# EasyEDA Pro project SciOly_EV_Controller_v1.epro, schematic Schematic1

## Sheets
1 1 Power: Board Name: Board1; Create Date: 2026-11-18; Page Name: P1; Project Name: SciOly EV Controller; Schematic Name: Schematic1; Update Date: 2026-11-18; Company: EasyEDA.com; Page Size: A4; Version: V1.0
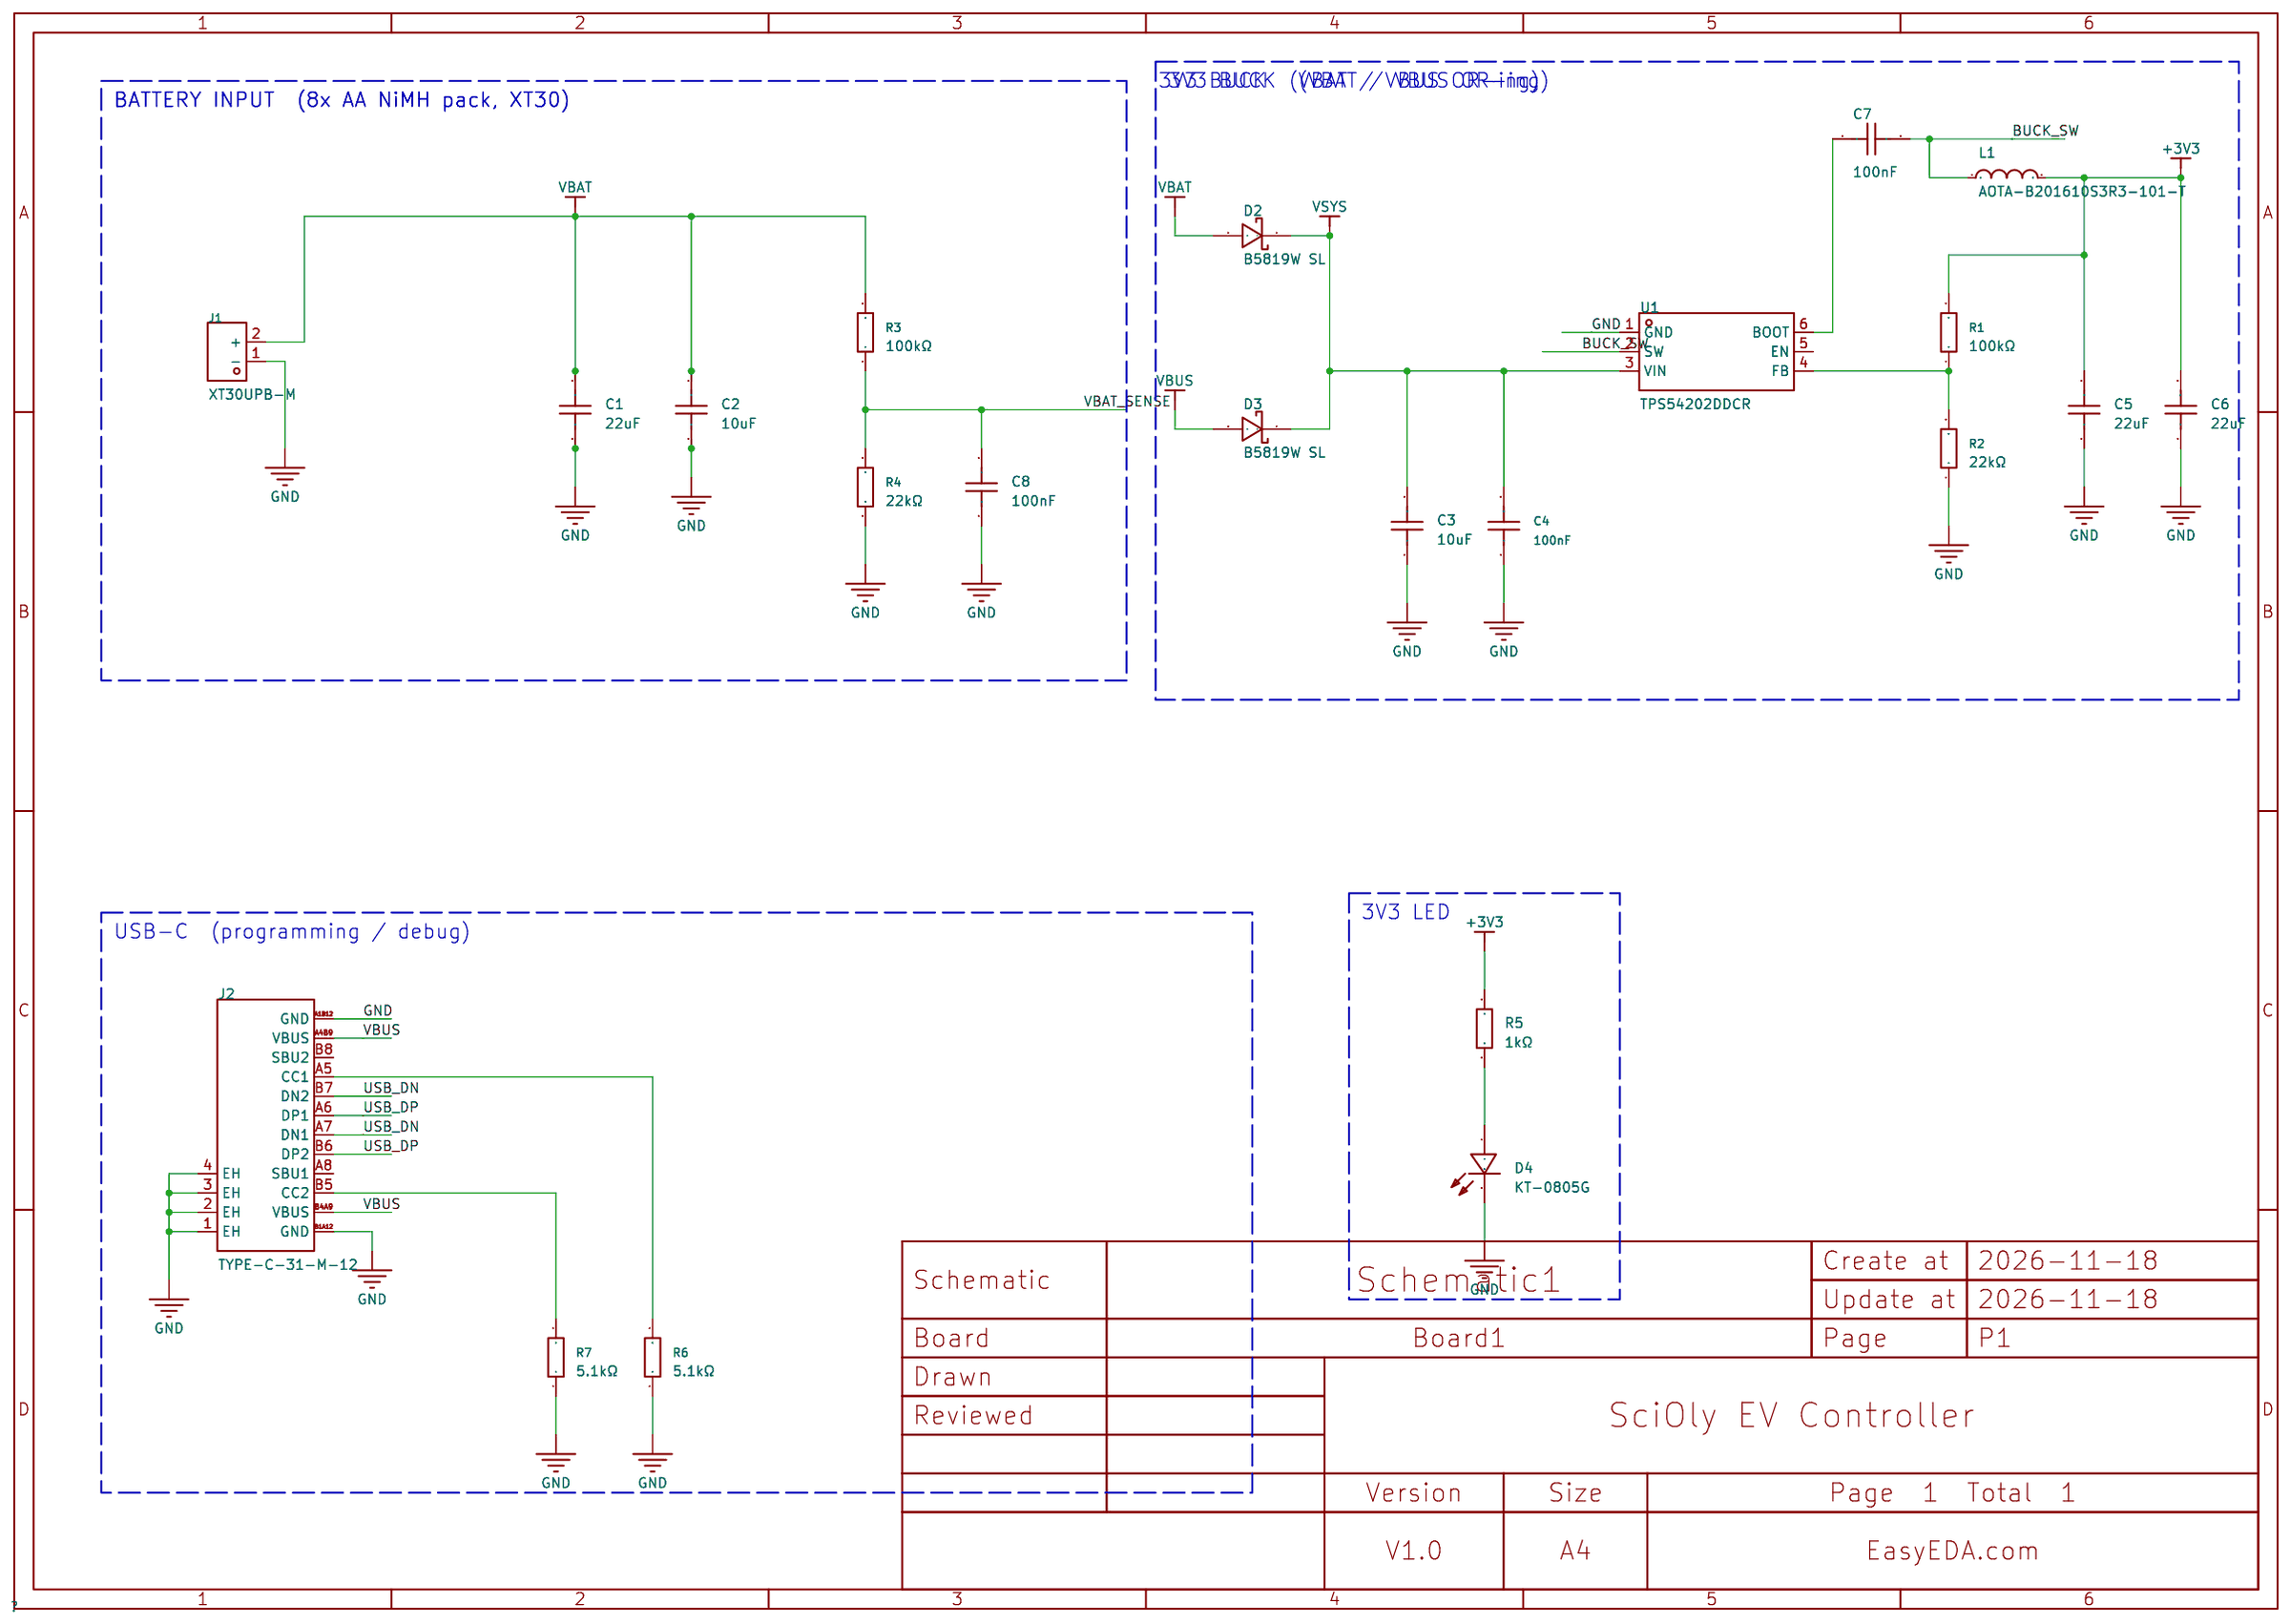
[diagram p0: 1 Power]
2 2 MCU: Page Name: 2 MCU; Update Date: 2026-11-20; Page Size: A3
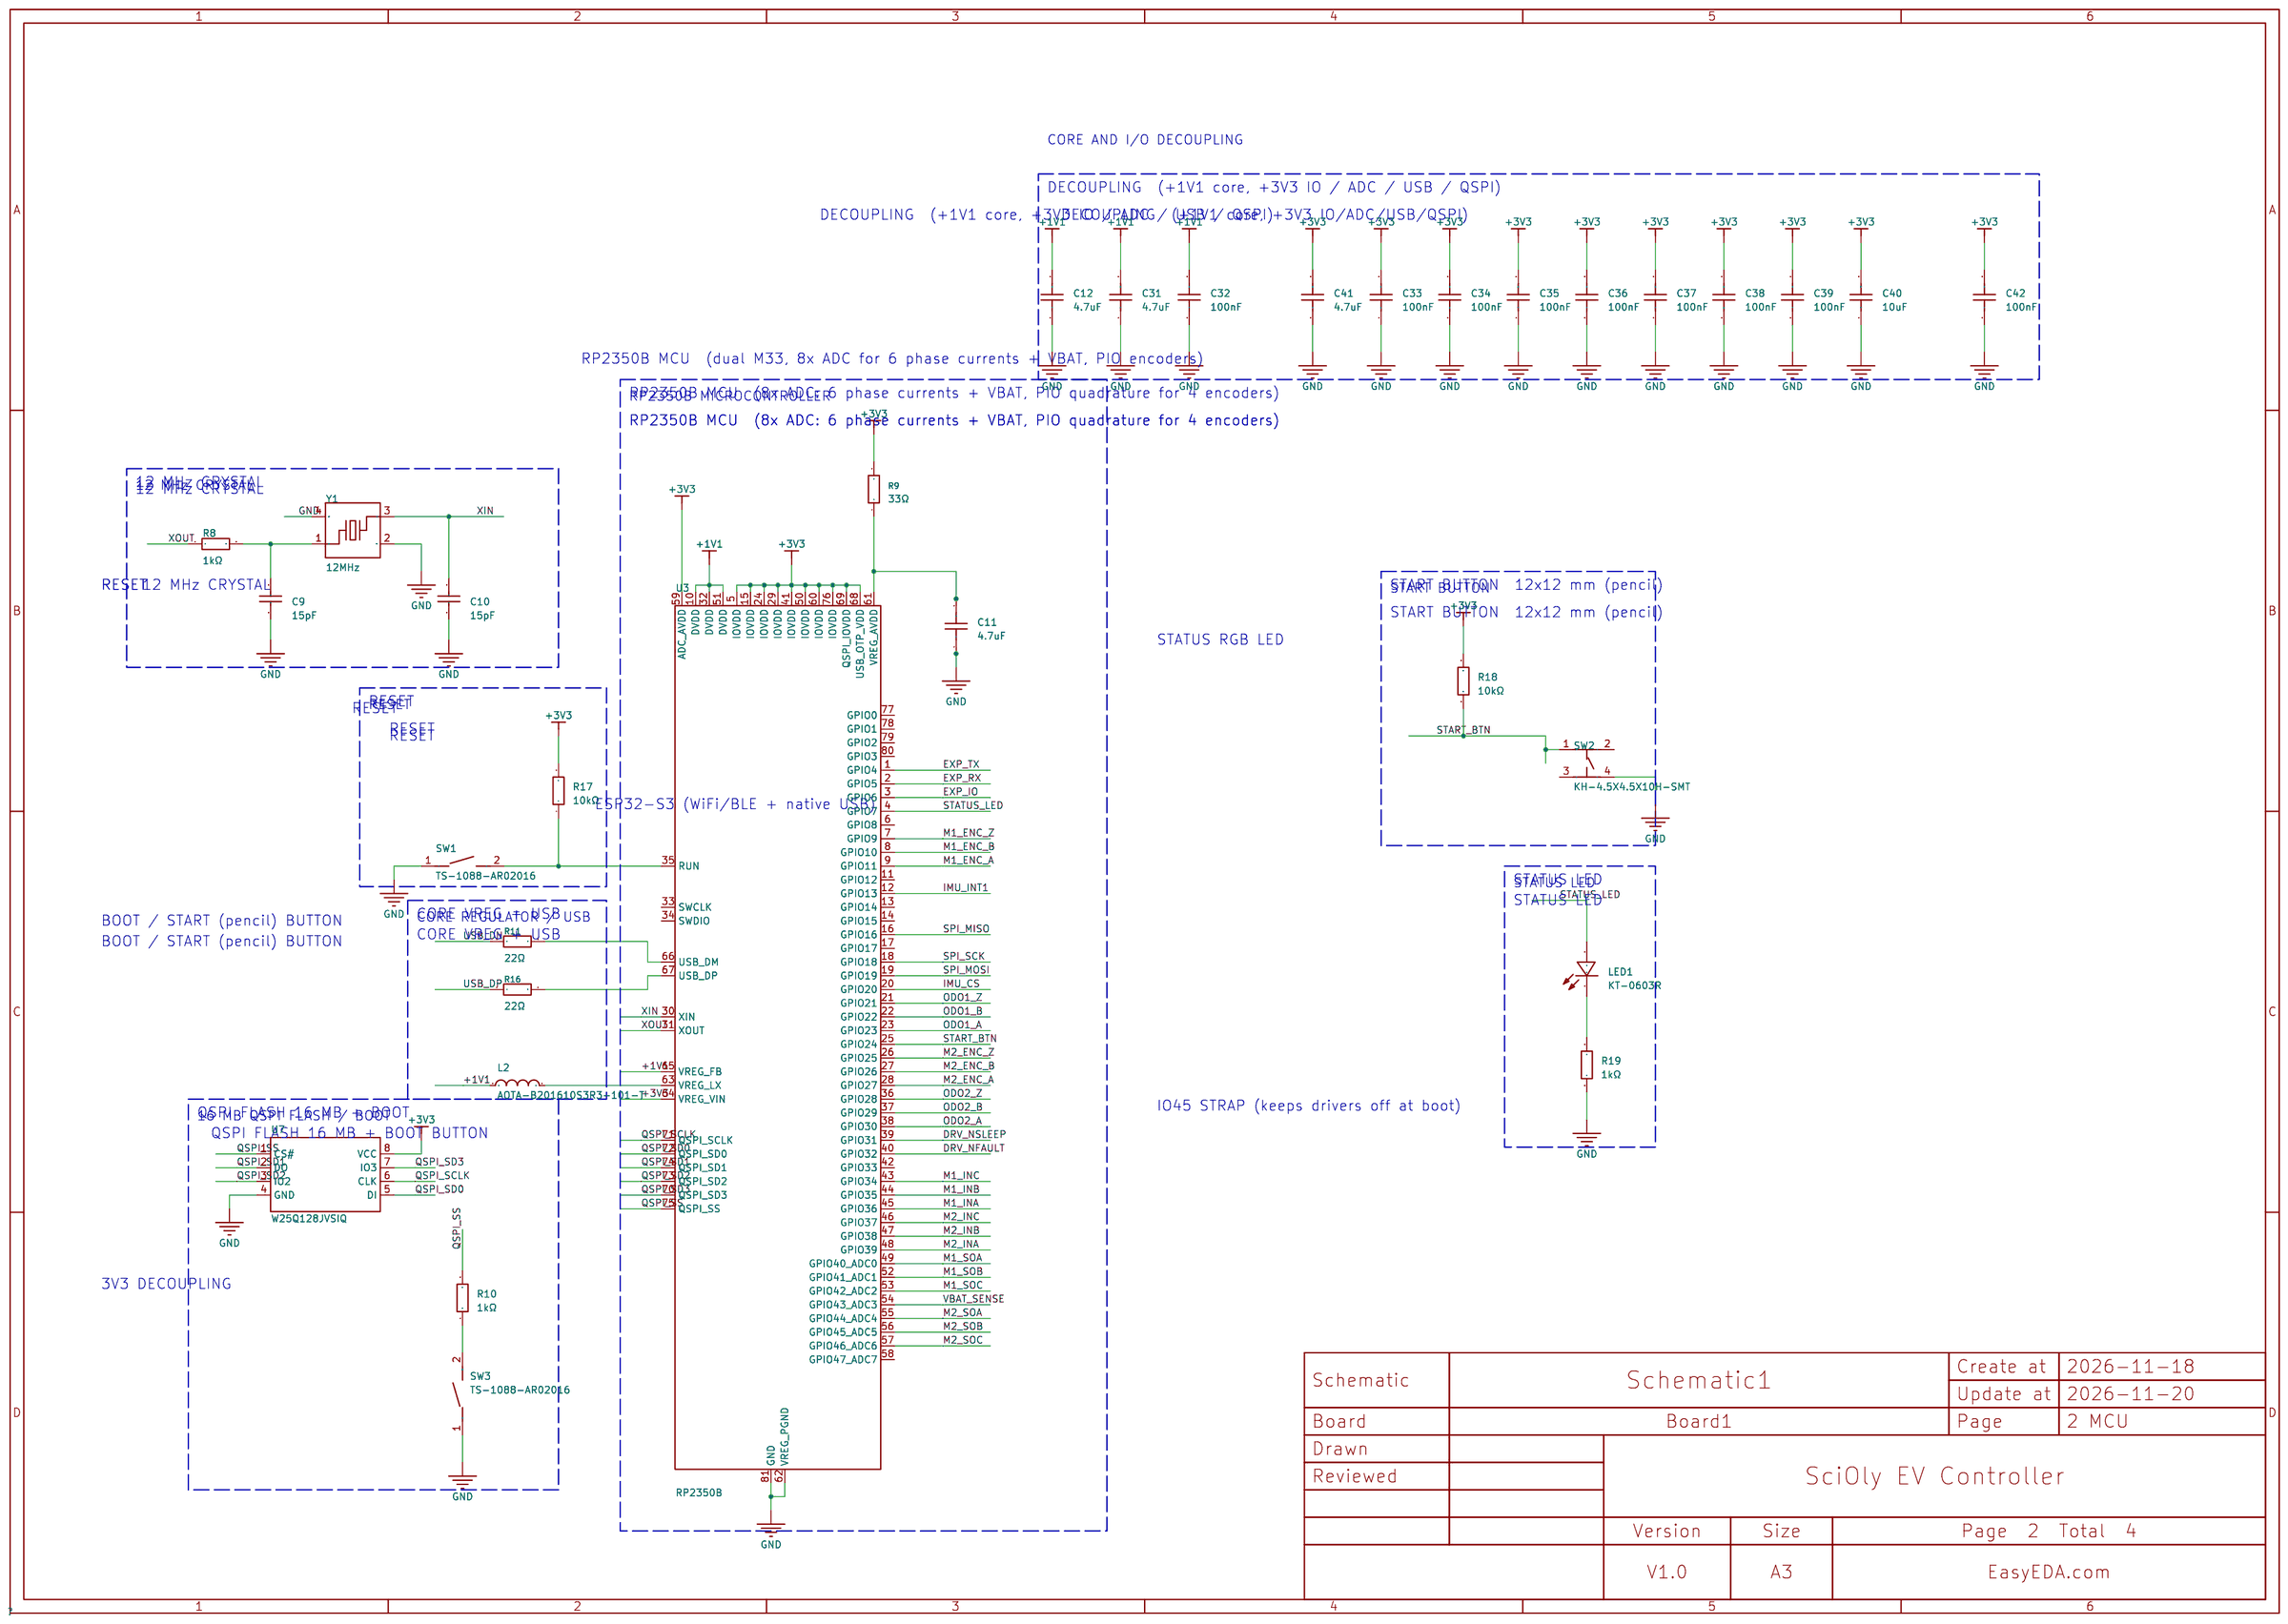
[diagram p1: 2 MCU]
3 3 Motor Drivers: Page Name: P2
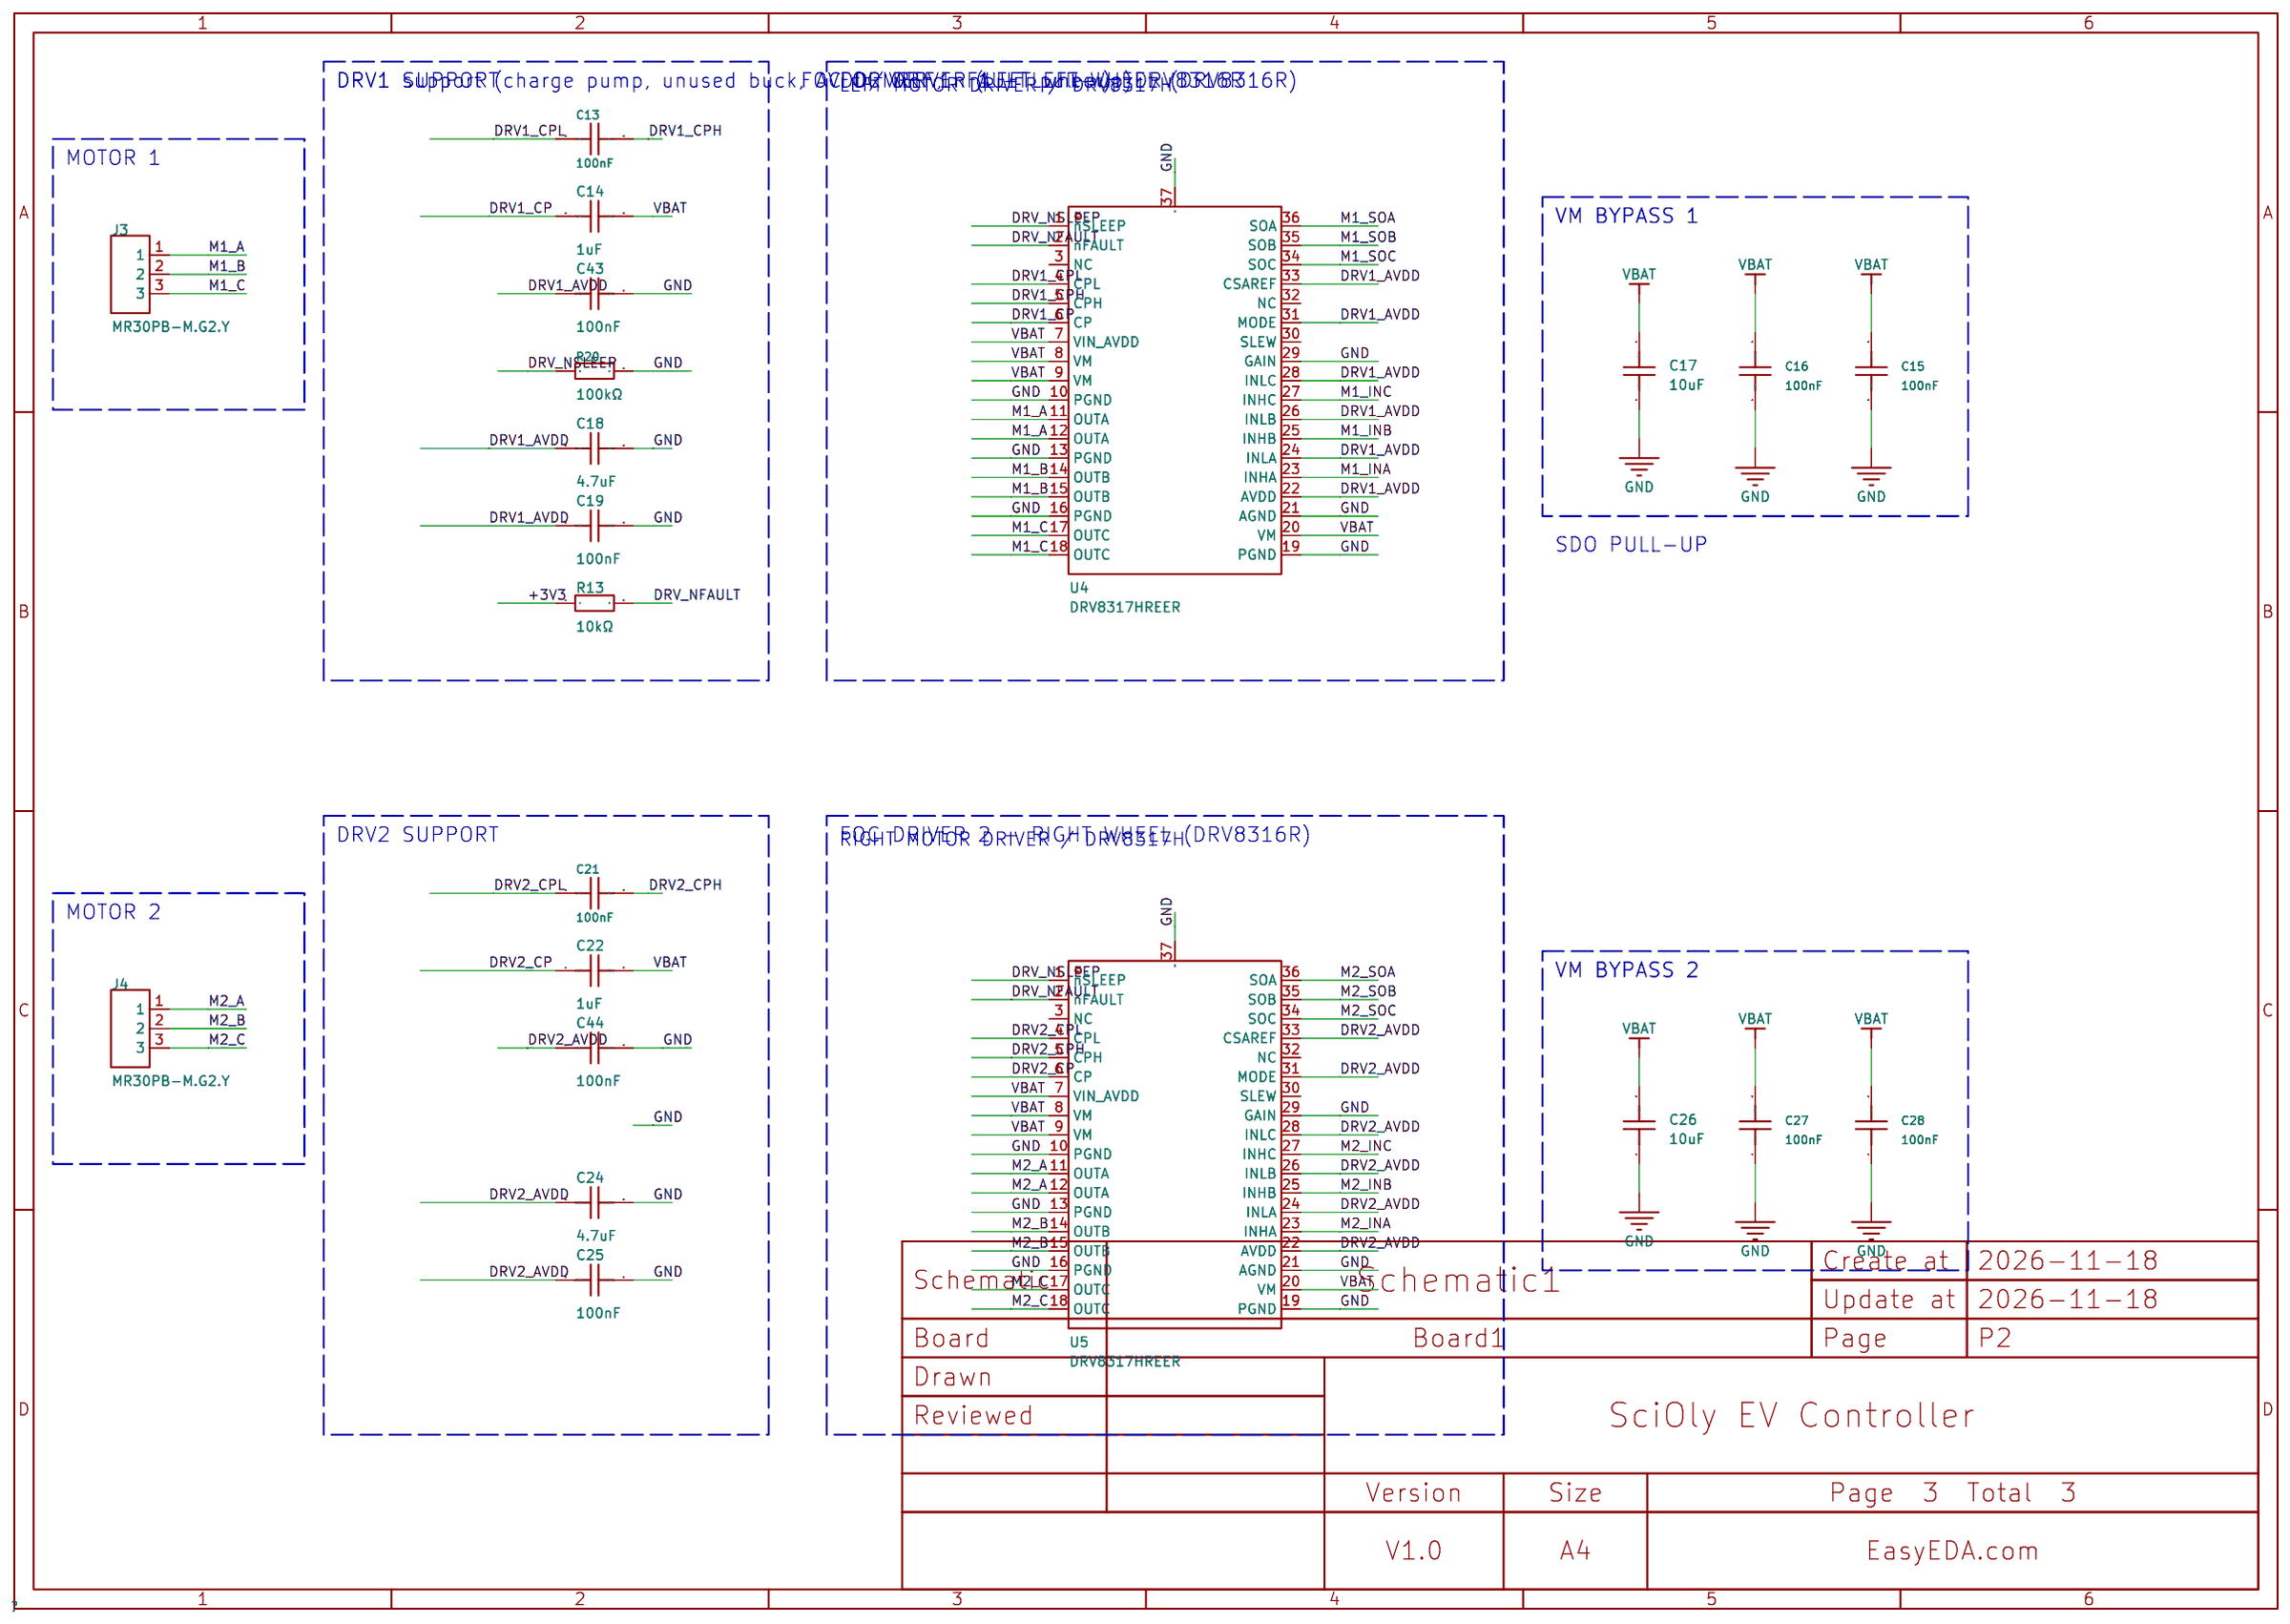
[diagram p2: 3 Motor Drivers]
4 4 Sensors and IO
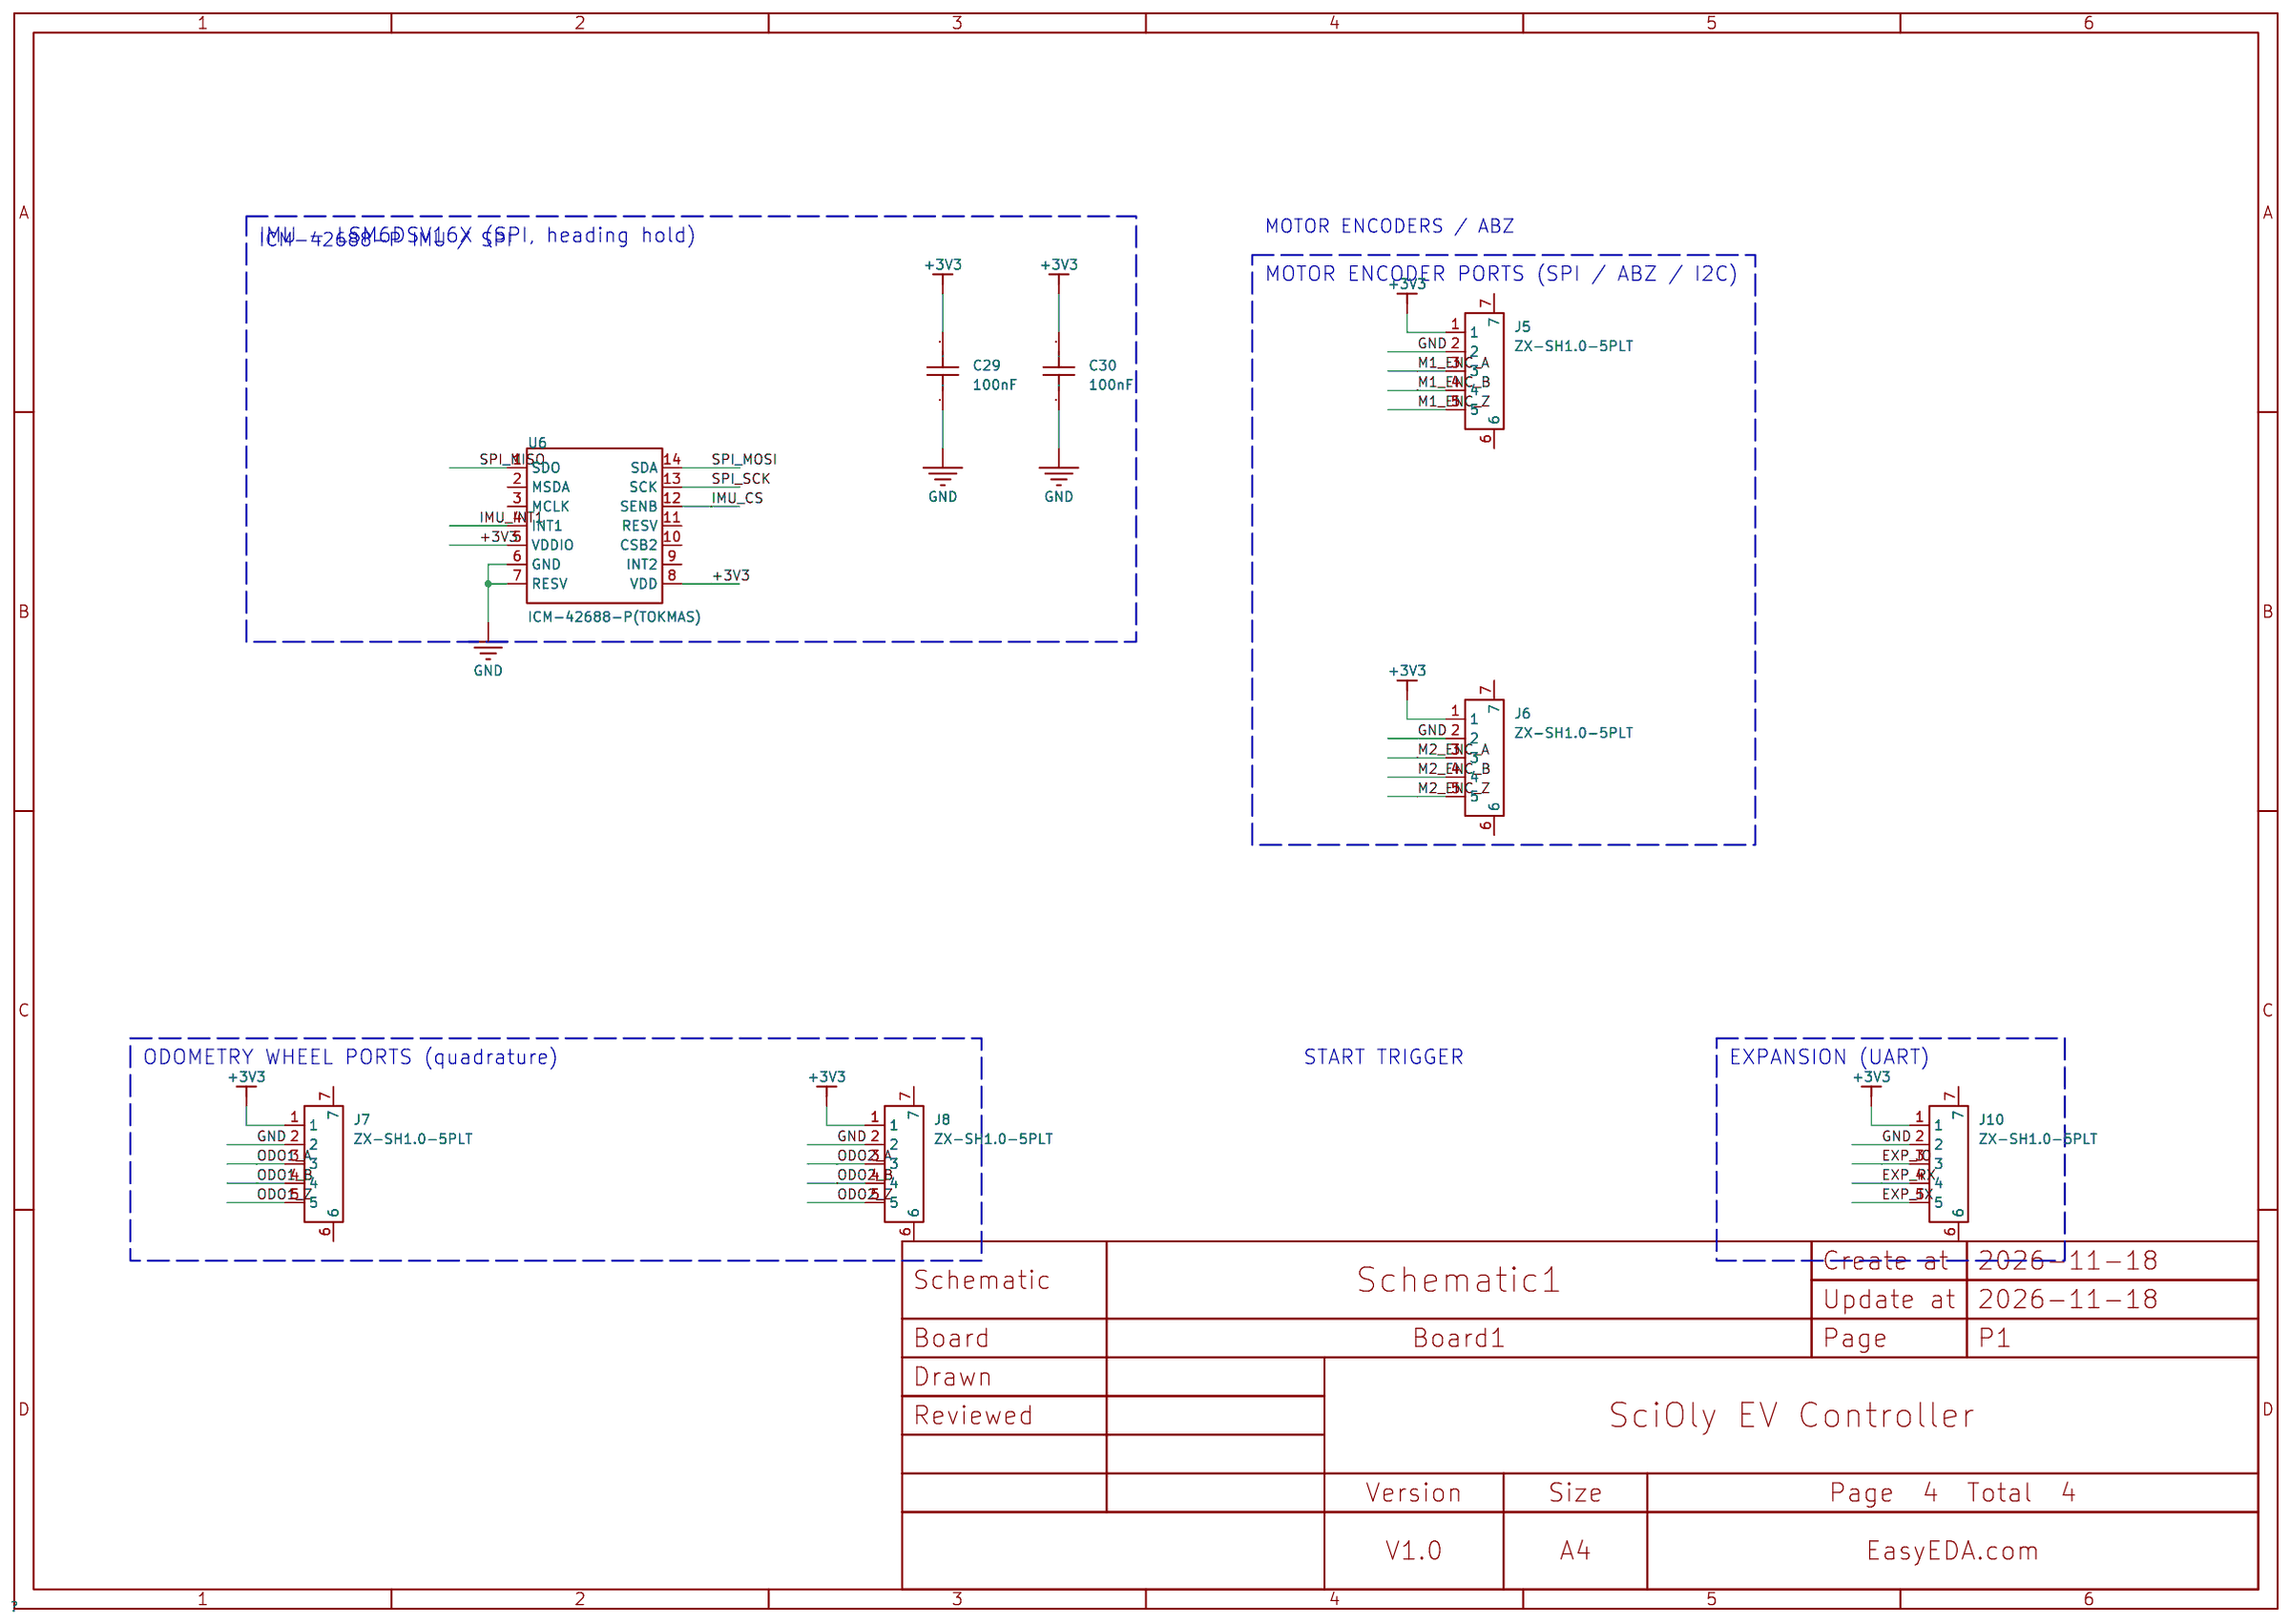
[diagram p3: 4 Sensors and IO]

## Parts
sheet 1 Power
C1  22uF  [C0805]
C2  10uF  [C0805]
C3  10uF  [C0805]
C4  100nF  [C0603]
C5  22uF  [C0805]
C6  22uF  [C0805]
C7  100nF  [C0402]
C8  100nF  [C0402]
D2  B5819W SL  [SOD-123_L2.7-W1.6-LS3.7-RD-1]
D3  B5819W SL  [SOD-123_L2.7-W1.6-LS3.7-RD-1]
D4  KT-0805G  [LED0805-R-RD]
J1  XT30UPB-M  [CONN-TH_XT30UPB-M]
J2  TYPE-C-31-M-12  [USB-C_SMD-TYPE-C-31-M-12_1]
L1  3.3uH  [IND-SMD_L2.0-W1.6_AOTA-B201610S3R3-101-T]
R1  100kΩ  [R0402]
R2  22kΩ  [R0402]
R3  100kΩ  [R0402]
R4  22kΩ  [R0402]
R5  1kΩ  [R0402]
R6  5.1kΩ  [R0402]
R7  5.1kΩ  [R0402]
U1  TPS54202DDCR  [SOT-23-6_L2.9-W1.6-P0.95-LS2.8-BL]
sheet 2 MCU
C9  15pF  [C0402]
C10  15pF  [C0402]
C11  4.7uF  [C0402]
C12  4.7uF  [C0402]
C31  4.7uF  [C0402]
C32  100nF  [C0402]
C33  100nF  [C0402]
C34  100nF  [C0402]
C35  100nF  [C0402]
C36  100nF  [C0402]
C37  100nF  [C0402]
C38  100nF  [C0402]
C39  100nF  [C0402]
C40  10uF  [C0603]
C41  4.7uF  [C0402]
C42  100nF  [C0402]
L2  3.3uH  [IND-SMD_L2.0-W1.6_AOTA-B201610S3R3-101-T]
LED1  KT-0603R  [LED-SMD_L1.6-W0.8-R-RD]
R8  1kΩ  [R0402]
R9  33Ω  [R0402]
R10  1kΩ  [R0402]
R11  22Ω  [R0402]
R16  22Ω  [R0402]
R17  10kΩ  [R0402]
R18  10kΩ  [R0402]
R19  1kΩ  [R0402]
SW1  TS-1088-AR02016  [SW-SMD_L3.9-W3.0-P4.45]
SW2  KH-4.5X4.5X10H-SMT  [SW-SMD_4P-L4.5-W4.5-P3.00-LS6.8]
SW3  TS-1088-AR02016  [SW-SMD_L3.9-W3.0-P4.45]
U3  RP2350B  [QFN-80_L10.0-W10.0-P0.40-TL-EP3.4]
U7  W25Q128JVSIQ  [SOIC-8_L5.3-W5.3-P1.27-LS8.0-BL]
Y1  12MHz  [CRYSTAL-SMD_4P-L3.2-W2.5-BL]
sheet 3 Motor Drivers
C13  100nF  [C0603]
C14  1uF  [C0402]
C15  100nF  [C0603]
C16  100nF  [C0603]
C17  10uF  [C0805]
C18  4.7uF  [C0402]
C19  100nF  [C0402]
C21  100nF  [C0603]
C22  1uF  [C0402]
C24  4.7uF  [C0402]
C25  100nF  [C0402]
C26  10uF  [C0805]
C27  100nF  [C0603]
C28  100nF  [C0603]
C43  100nF  [C0402]
C44  100nF  [C0402]
J3  MR30PB-M.G2.Y  [CONN-TH_MR30PB-M]
J4  MR30PB-M.G2.Y  [CONN-TH_MR30PB-M]
R13  10kΩ  [R0402]
R20  100kΩ  [R0402]
U4  DRV8317HREER  [QFN-36_L5.0-W4.0-P0.40-BL-EP]
U5  DRV8317HREER  [QFN-36_L5.0-W4.0-P0.40-BL-EP]
sheet 4 Sensors and IO
C29  100nF  [C0402]
C30  100nF  [C0402]
J5  ZX-SH1.0-5PLT  [CONN-SMD_5P-P1.00_ZX-SH1.0-5PLT]
J6  ZX-SH1.0-5PLT  [CONN-SMD_5P-P1.00_ZX-SH1.0-5PLT]
J7  ZX-SH1.0-5PLT  [CONN-SMD_5P-P1.00_ZX-SH1.0-5PLT]
J8  ZX-SH1.0-5PLT  [CONN-SMD_5P-P1.00_ZX-SH1.0-5PLT]
J10  ZX-SH1.0-5PLT  [CONN-SMD_5P-P1.00_ZX-SH1.0-5PLT]
U6  ICM-42688-P(TOKMAS)  [LGA-14_L3.0-W2.5-P0.50-BL]

## Library data of the parts
C1 C5 C6 = CL21A226MAQNNNE: Capacitance:22uF Tolerance:±20% Tolerance:±20% Voltage Rating:25V Temperature Coefficient:X5R; LCSC Part Name: 22uF ±20% 25V; Supplier Part: C45783; Manufacturer: SAMSUNG(三星); Supplier Footprint: 0805; JLCPCB Part Class: Basic Part; Datasheet: https://item.szlcsc.com/datasheet/CL21A226MAQNNNE/46786.html; Supplier: LCSC; Tolerance: ±20%; Voltage Rating: 25V; Temperature Coefficient: X5R
C2 C3 C17 C26 = CL21A106KAYNNNE_C15850: Capacitance:10uF Tolerance:±10% Tolerance:±10% Voltage Rating:25V Temperature Coefficient:X5R; LCSC Part Name: 10uF ±10% 25V; Supplier Part: C15850; Manufacturer: SAMSUNG(三星); Manufacturer Part: CL21A106KAYNNNE; Supplier Footprint: 0805; JLCPCB Part Class: Basic Part; Datasheet: https://item.szlcsc.com/datasheet/CL21A106KAYNNNE/16532.html; Supplier: LCSC; Tolerance: ±10%; Voltage Rating: 25V; Temperature Coefficient: X5R
C4 C13 C15 C16 C21 C27 C28 = CC0603KRX7R9BB104: Capacitance:100nF Tolerance:±10% Tolerance:±10% Voltage Rating:50V Temperature Coefficient:X7R; LCSC Part Name: 100nF ±10% 50V; Supplier Part: C14663; Manufacturer: YAGEO(国巨); Supplier Footprint: 0603; JLCPCB Part Class: Basic Part; Datasheet: https://item.szlcsc.com/datasheet/CC0603KRX7R9BB104/15331.html; Supplier: LCSC; Tolerance: ±10%; Voltage Rating: 50V; Temperature Coefficient: X7R
C7 C8 C19 C25 C29 C30 C32-C39 C42-C44 = CL05B104KO5NNNC: Capacitance:100nF Tolerance:±10% Tolerance:±10% Voltage Rating:16V Temperature Coefficient:X7R; LCSC Part Name: 100nF ±10% 16V; Supplier Part: C1525; Manufacturer: SAMSUNG(三星); Supplier Footprint: 0402; JLCPCB Part Class: Basic Part; Datasheet: https://item.szlcsc.com/datasheet/CL05B104KO5NNNC/1877.html; Supplier: LCSC; Tolerance: ±10%; Voltage Rating: 16V; Temperature Coefficient: X7R
D2 D3 = B5819W SL: Voltage - Forward(Vf@If):600mV@1A Voltage - DC Reverse(Vr):40V Current - Rectified:1A Non-Repetitive Peak Forward Surge Current:9A; LCSC Part Name: 电压:40V 电流:1A; Supplier Part: C8598; Manufacturer: CJ(江苏长电/长晶); Supplier Footprint: SOD-123; JLCPCB Part Class: Basic Part; Datasheet: https://item.szlcsc.com/datasheet/B5819W%2520SL/9093.html; Supplier: LCSC; Voltage - Forward(Vf@If): 600mV@1A; Voltage - DC Reverse(Vr): 40V; Current - Rectified: 1A; Non-Repetitive Peak Forward Surge Current: 9A
D4 = KT-0805G: Lamp Holder Type:2mm x 1.25mm square LED Illumination Color:Emerald Green Voltage - Forward(Vf):2.6V~3.1V Voltage - Forward(Vf):2.6V~3.1V Power(Watts):100mW Forward Current:5mA Wavelength - Dominant:513nm~528nm Wavelength - Dominant:513nm~528nm Peak Wavel; LCSC Part Name: 0805 翠绿 高亮; Supplier Part: C2297; Manufacturer: KENTO; Supplier Footprint: 0805; JLCPCB Part Class: Basic Part; Datasheet: https://item.szlcsc.com/datasheet/KT-0805G/2670.html; Supplier: LCSC; Lamp Holder Type: 2mm x 1.25mm square LED; Illumination Color: Emerald Green; Voltage - Forward(Vf): 2.6V~3.1V; Power(Watts): 100mW; Forward Current: 5mA; Wavelength - Dominant: 513nm~528nm; Peak Wavelength: 525nm; Diode Configuration: Discrete Diode; Lens Color: Water Clear; Luminous Intensity: 430mcd; Viewing Angle: 120°; Operating Temperature: -40℃~+85℃
J1 = XT30UPB-M: Rated current:15A Rated voltage: colour:Yellow Connector type:Model aircraft plug contact resistance: interface form:Male insulating material: metal material:Gold plating; LCSC Part Name: AMASS(艾迈斯)板载立式 航模锂电池控制器连接器插头 PCB板立式 公头XT30UPB-M.G.Y; Supplier Part: C428721; Manufacturer: AMASS(艾迈斯); JLCPCB Part Class: Extended Part; Datasheet: https://item.szlcsc.com/datasheet/XT30UPB-M/423831.html; Supplier: LCSC; Rated current: 15A; colour: Yellow; Connector type: Model aircraft plug; interface form: Male; metal material: Gold plating
J2 = TYPE-C-31-M-12: Connector Type:Type-C Protocol Standard:- Gender:Female Mounting Type:Surface Mount, Right Angle Number of Contacts:16P Number of Ports:1 Current Rating-Power:5A Voltage Rating:20V Connect-Disconnect Life:10,000 cycles Length:7.35mm Operating Temperature:; LCSC Part Name: Type-C 母 卧贴; Supplier Part: C165948; Manufacturer: 韩国韩荣; Supplier Footprint: SMD; JLCPCB Part Class: Extended Part; Datasheet: https://item.szlcsc.com/datasheet/TYPE-C-31-M-12/177331.html; Supplier: LCSC; Connector Type: Type-C; Gender: Female; Mounting Type: Surface Mount, Right Angle; Number of Contacts: 16P; Number of Ports: 1; Current Rating-Power: 5A; Voltage Rating: 20V; Connect-Disconnect Life: 10,000 cycles; Length: 7.35mm; Operating Temperature: -30℃~+80℃
L1 L2 = AOTA-B201610S3R3-101-T: LCSC Part Name: 3.3uH 2.4A; Supplier Part: C42411119; Manufacturer: ABRACON; Supplier Footprint: 0806; JLCPCB Part Class: Extended Part; Datasheet: https://item.szlcsc.com/datasheet/AOTA-B201610S3R3-101-T/44392932.html; Supplier: LCSC
R1 R3 R20 = 0402WGF1003TCE: Type:Thick Film Resistor Resistance:100kΩ Tolerance:±1% Tolerance:±1% Power(Watts):62.5mW Voltage-Supply(Max):50V Temperature Coefficient:±100ppm/℃ Temperature Coefficient:±100ppm/℃ Operating Temperature:-55℃~+155℃ Operating Temperature:-55℃~+155℃; LCSC Part Name: 厚膜电阻 100kΩ ±1%; Supplier Part: C25741; Manufacturer: UNI-ROYAL(厚声); Supplier Footprint: 0402; JLCPCB Part Class: Basic Part; Datasheet: https://item.szlcsc.com/datasheet/0402WGF1003TCE/26484.html; Supplier: LCSC; Type: Thick Film Resistor; Tolerance: ±1%; Power(Watts): 62.5mW; Voltage-Supply(Max): 50V; Temperature Coefficient: ±100ppm/℃; Operating Temperature: -55℃~+155℃
R2 R4 = 0402WGF2202TCE: Type:Thick Film Resistor Resistance:22kΩ Tolerance:±1% Tolerance:±1% Power(Watts):62.5mW Voltage-Supply(Max):50V Temperature Coefficient:±100ppm/℃ Temperature Coefficient:±100ppm/℃ Operating Temperature:-55℃~+155℃ Operating Temperature:-55℃~+155℃; LCSC Part Name: 厚膜电阻 22kΩ ±1%; Supplier Part: C25768; Manufacturer: UNI-ROYAL(厚声); Supplier Footprint: 0402; JLCPCB Part Class: Basic Part; Datasheet: https://item.szlcsc.com/datasheet/0402WGF2202TCE/26511.html; Supplier: LCSC; Type: Thick Film Resistor; Tolerance: ±1%; Power(Watts): 62.5mW; Voltage-Supply(Max): 50V; Temperature Coefficient: ±100ppm/℃; Operating Temperature: -55℃~+155℃
R5 R8 R10 R19 = 0402WGF1001TCE: Type:Thick Film Resistor Resistance:1kΩ Tolerance:±1% Tolerance:±1% Power(Watts):62.5mW Voltage-Supply(Max):50V Temperature Coefficient:±100ppm/℃ Temperature Coefficient:±100ppm/℃ Operating Temperature:-55℃~+155℃ Operating Temperature:-55℃~+155℃; LCSC Part Name: 厚膜电阻 1kΩ ±1%; Supplier Part: C11702; Manufacturer: UNI-ROYAL(厚声); Supplier Footprint: 0402; JLCPCB Part Class: Basic Part; Datasheet: https://item.szlcsc.com/datasheet/0402WGF1001TCE/12256.html; Supplier: LCSC; Type: Thick Film Resistor; Tolerance: ±1%; Power(Watts): 62.5mW; Voltage-Supply(Max): 50V; Temperature Coefficient: ±100ppm/℃; Operating Temperature: -55℃~+155℃
R6 R7 = 0402WGF5101TCE: Type:Thick Film Resistor Resistance:5.1kΩ Tolerance:±1% Tolerance:±1% Power(Watts):62.5mW Voltage-Supply(Max):50V Temperature Coefficient:±100ppm/℃ Temperature Coefficient:±100ppm/℃ Operating Temperature:-55℃~+155℃ Operating Temperature:-55℃~+155℃; LCSC Part Name: 厚膜电阻 5.1kΩ ±1%; Supplier Part: C25905; Manufacturer: UNI-ROYAL(厚声); Supplier Footprint: 0402; JLCPCB Part Class: Basic Part; Datasheet: https://item.szlcsc.com/datasheet/0402WGF5101TCE/26648.html; Supplier: LCSC; Type: Thick Film Resistor; Tolerance: ±1%; Power(Watts): 62.5mW; Voltage-Supply(Max): 50V; Temperature Coefficient: ±100ppm/℃; Operating Temperature: -55℃~+155℃
U1 = TPS54202DDCR: Function:Step-down type Voltage - Supply:4.5V~28V Voltage - Supply:4.5V~28V Output Voltage:- Output Voltage:- Output Current:2A Frequency - Switching:500kHz Frequency - Switching:500kHz Operating Temperature:-40℃~+125℃@(TJ) Operating Temperature:-40℃~+125; LCSC Part Name: 降压型 2A 4.5V~28V; Supplier Part: C191884; Manufacturer: TI(德州仪器); Supplier Footprint: SOT-23-6; JLCPCB Part Class: Extended Part; Datasheet: https://www.ti.com/cn/lit/ds/symlink/tps54202.pdf; Supplier: LCSC; Function: Step-down type; Voltage - Supply: 4.5V~28V; Output Current: 2A; Frequency - Switching: 500kHz; Operating Temperature: -40℃~+125℃@(TJ); Synchronous Rectifier: Yes; Number of Outputs: 1; Topology: Buck; Quiescent Current: 45uA; Switch tube (built-in/external): Built-in; Output Type: Adjustable; Features: Light load efficient mode；Cycle-by-cycle current limiting；Overcurrent Protection；EMI optimization (spread spectrum)；Hiccup current limiting
C9 C10 = 0402CG150J500NT: Capacitance:15pF Tolerance:±5% Tolerance:±5% Voltage Rating:50V Temperature Coefficient:C0G; LCSC Part Name: 15pF ±5% 50V; Supplier Part: C1548; Manufacturer: FH(风华); Supplier Footprint: 0402; JLCPCB Part Class: Basic Part; Datasheet: https://item.szlcsc.com/datasheet/0402CG150J500NT/1900.html; Supplier: LCSC; Tolerance: ±5%; Voltage Rating: 50V; Temperature Coefficient: C0G
C11 C12 C18 C24 C31 C41 = CL05A475MP5NRNC: Capacitance:4.7uF Tolerance:±20% Tolerance:±20% Voltage Rating:10V Temperature Coefficient:X5R; LCSC Part Name: 4.7uF ±20% 10V; Supplier Part: C23733; Manufacturer: SAMSUNG(三星); Supplier Footprint: 0402; JLCPCB Part Class: Basic Part; Datasheet: https://item.szlcsc.com/datasheet/CL05A475MP5NRNC/24469.html; Supplier: LCSC; Tolerance: ±20%; Voltage Rating: 10V; Temperature Coefficient: X5R
C40 = CL10A106KP8NNNC: Capacitance:10uF Tolerance:±10% Tolerance:±10% Voltage Rating:10V Temperature Coefficient:X5R; LCSC Part Name: 10uF ±10% 10V; Supplier Part: C19702; Manufacturer: SAMSUNG(三星); Supplier Footprint: 0603; JLCPCB Part Class: Basic Part; Datasheet: https://item.szlcsc.com/datasheet/CL10A106KP8NNNC/20411.html; Supplier: LCSC; Tolerance: ±10%; Voltage Rating: 10V; Temperature Coefficient: X5R
LED1 = KT-0603R: Lamp Holder Type:1.6mm x 0.8mm square LED Illumination Color:Red Voltage - Forward(Vf):1.8V~2.4V Voltage - Forward(Vf):1.8V~2.4V Power(Watts):40mW Forward Current:20mA Wavelength - Dominant:615nm~630nm Wavelength - Dominant:615nm~630nm Peak Wavelength:645; LCSC Part Name: 0603 红灯 高亮; Supplier Part: C2286; Manufacturer: KENTO; Supplier Footprint: 0603; JLCPCB Part Class: Basic Part; Datasheet: https://item.szlcsc.com/datasheet/KT-0603R/2659.html; Supplier: LCSC; Lamp Holder Type: 1.6mm x 0.8mm square LED; Illumination Color: Red; Voltage - Forward(Vf): 1.8V~2.4V; Power(Watts): 40mW; Forward Current: 20mA; Wavelength - Dominant: 615nm~630nm; Peak Wavelength: 645nm; Diode Configuration: Discrete Diode; Lens Color: Water Clear; Luminous Intensity: 300mcd; Viewing Angle: 120°; Operating Temperature: -40℃~+85℃
R9 = 0402WGF330JTCE: Type:Thick Film Resistor Resistance:33Ω Tolerance:±1% Tolerance:±1% Power(Watts):62.5mW Voltage-Supply(Max):50V Temperature Coefficient:±100ppm/℃ Temperature Coefficient:±100ppm/℃ Operating Temperature:-55℃~+155℃ Operating Temperature:-55℃~+155℃; LCSC Part Name: 33Ω ±1% 62.5mW 厚膜电阻; Supplier Part: C25105; Manufacturer: UNI-ROYAL(厚声); Supplier Footprint: 0402; JLCPCB Part Class: Basic Part; Datasheet: https://item.szlcsc.com/datasheet/0402WGF330JTCE/25848.html; Supplier: LCSC; Type: Thick Film Resistor; Tolerance: ±1%; Power(Watts): 62.5mW; Voltage-Supply(Max): 50V; Temperature Coefficient: ±100ppm/℃; Operating Temperature: -55℃~+155℃
R11 R16 = 0402WGF220JTCE: Type:Thick Film Resistors Resistance:22Ω Tolerance:±1% Tolerance:±1% Power(Watts): Overload Voltage (Max): Temperature Coefficient:±100ppm/℃ Temperature Coefficient:±100ppm/℃ Operating Temperature Range:-55℃~+155℃ Operating Temperature Range:-55℃~+155℃; LCSC Part Name: 22Ω ±1% 62.5mW 厚膜电阻; Supplier Part: C25092; Manufacturer: UNI-ROYAL(厚声); Supplier Footprint: 0402; JLCPCB Part Class: Basic Part; Datasheet: https://atta.szlcsc.com/upload/public/pdf/source/20200306/C422600_1E6D84923E4A46A82E41ADD87F860B5C.pdf; Supplier: LCSC; Type: Thick Film Resistors; Tolerance: ±1%; Temperature Coefficient: ±100ppm/℃; Operating Temperature Range: -55℃~+155℃
R13 R17 R18 = 0402WGF1002TCE: Type:Thick Film Resistor Resistance:10kΩ Tolerance:±1% Tolerance:±1% Power(Watts):62.5mW Voltage-Supply(Max):50V Temperature Coefficient:±100ppm/℃ Temperature Coefficient:±100ppm/℃ Operating Temperature:-55℃~+155℃ Operating Temperature:-55℃~+155℃; LCSC Part Name: 厚膜电阻 10kΩ ±1%; Supplier Part: C25744; Manufacturer: UNI-ROYAL(厚声); Supplier Footprint: 0402; JLCPCB Part Class: Basic Part; Datasheet: https://item.szlcsc.com/datasheet/0402WGF1002TCE/26487.html; Supplier: LCSC; Type: Thick Film Resistor; Tolerance: ±1%; Power(Watts): 62.5mW; Voltage-Supply(Max): 50V; Temperature Coefficient: ±100ppm/℃; Operating Temperature: -55℃~+155℃
SW1 SW3 = TS-1088-AR02016: Circuit:SPST Actuator Style:Round Button Operating Force:1.6N Mounting Type:Surface Mount,Vertical Length:3.9mm Width:3mm Switch Height:2mm with Bracket:Without Bracket Contact Current:50mA Voltage Rating:12V Actuator/Cap Color:Black With Lamp:- IP Rating; LCSC Part Name: 3.9*3*2mm 立贴 轻触开关; Supplier Part: C720477; Manufacturer: XUNPU(讯普); Supplier Footprint: SMD,4x3mm; JLCPCB Part Class: Basic Part; Datasheet: https://item.szlcsc.com/datasheet/TS-1088-AR02016/763484.html; Supplier: LCSC; Circuit: SPST; Actuator Style: Round Button; Operating Force: 1.6N; Mounting Type: Surface Mount,Vertical; Length: 3.9mm; Width: 3mm; Switch Height: 2mm; with Bracket: Without Bracket; Contact Current: 50mA; Voltage Rating: 12V; Actuator/Cap Color: Black; Termination Style: SMD(SMT) Tab; Life: 100,000 cycles; Operating Temperature: -30℃~+80℃
SW2 = KH-4.5X4.5X10H-SMT: Length:4.5mm Width:4.5mm Switch Height:10mm; LCSC Part Name: 4.5mm*4.5mm*10mm; Supplier Part: C6915267; Manufacturer: kinghelm(金航标); Supplier Footprint: SMD,4.5x4.5mm; JLCPCB Part Class: Extended Part; Datasheet: https://item.szlcsc.com/datasheet/KH-4.5X4.5X10H-SMT/7879783.html; Supplier: LCSC; Length: 4.5mm; Width: 4.5mm; Switch Height: 10mm
U3 = RP2350B_C42415655: CPU Core:ARM Cortex-M33 CPU Maximum Speed:150MHz Core Size:32 Bit RAM Size:520KB Number of I/O:48 Features:Independent watchdog (IWDG)；Power-on reset (POR)；True random number generator (TRNG)；Watchdog reset；Built-in general-purpose timer；Hardware ECC chec; LCSC Part Name: 版本：A4 SC1510(13)-A4; Supplier Part: C42415655; Manufacturer: Raspberry Pi(树莓派); Supplier Footprint: QFN-80-EP(10x10); JLCPCB Part Class: Extended Part; Datasheet: https://item.szlcsc.com/datasheet/RP2350B/44413055.html; Supplier: LCSC; CPU Core: ARM Cortex-M33; CPU Maximum Speed: 150MHz; Core Size: 32 Bit; RAM Size: 520KB; Number of I/O: 48; Features: Independent watchdog (IWDG)；Power-on reset (POR)；True random number generator (TRNG)；Watchdog reset；Built-in general-purpose timer；Hardware ECC check；External pin reset (NRST)；Integrated LDO
U7 = W25Q128JVSIQ: Interface:SPI Memory Size:128Mbit Clock Frequency:133MHz Voltage - Supply:2.7V~3.6V Voltage - Supply:2.7V~3.6V Standby Supply Current:1uA Program / Erase Cycles:100,000 cycles Write Cycle Time (tWC):- Page Programming Time (Tpp):3ms Block Erase Time(tBE):; LCSC Part Name: 编带 支持双路/四路SPI接口的3V、128Mbit 串行闪存; Supplier Part: C97521; Manufacturer: Winbond(华邦); Supplier Footprint: SOIC-8-208mil; JLCPCB Part Class: Basic Part; Datasheet: https://item.szlcsc.com/datasheet/W25Q128JVSIQ/98729.html; Supplier: LCSC; Interface: SPI; Memory Size: 128Mbit; Clock Frequency: 133MHz; Voltage - Supply: 2.7V~3.6V; Standby Supply Current: 1uA; Program / Erase Cycles: 100,000 cycles; Page Programming Time (Tpp): 3ms; Block Erase Time(tBE): 120ms@(32KB); Data Retention - TDR (Year): 20 Years; Operating Temperature: -40℃~+85℃; Features: Hardware write protection；Absolute write protection；Write enable latch；Software write protection；Power-on reset
Y1 = ABM8-272-T3_C20625731: Type:SMD crystal oscillator Frequency:12MHz Normal temperature Frequency Tolerance:±30ppm Normal temperature Frequency Tolerance:±30ppm Load Capacitance:10pF Frequency Stability:±30ppm Frequency Stability:±30ppm Equivalent Series Resistance(ESR):50Ω Opera; LCSC Part Name: 12MHz ±30ppm 10pF; Supplier Part: C20625731; Manufacturer: ABRACON; Manufacturer Part: ABM8-272-T3; Supplier Footprint: SMD3225-4P; JLCPCB Part Class: Extended Part; Datasheet: https://item.szlcsc.com/datasheet/ABM8-272-T3/22032038.html; Supplier: LCSC; Type: SMD crystal oscillator; Normal temperature Frequency Tolerance: ±30ppm; Load Capacitance: 10pF; Frequency Stability: ±30ppm; Equivalent Series Resistance(ESR): 50Ω; Operating Temperature: -40℃~+85℃
C14 C22 = CL05A105KA5NQNC: Capacitance:1uF Tolerance:±10% Tolerance:±10% Voltage Rating:25V Temperature Coefficient:X5R; LCSC Part Name: 1uF ±10% 25V; Supplier Part: C52923; Manufacturer: SAMSUNG(三星); Supplier Footprint: 0402; JLCPCB Part Class: Basic Part; Datasheet: https://item.szlcsc.com/datasheet/CL05A105KA5NQNC/53938.html; Supplier: LCSC; Tolerance: ±10%; Voltage Rating: 25V; Temperature Coefficient: X5R
J3 J4 = MR30PB-M.G2.Y: LCSC Part Name: AMASS(艾迈斯)三芯动力电池马达电调航模插头连接器 PCB板立式插头公头MR30PB-M.G2.Y; Supplier Part: C52287275; Manufacturer: AMASS(艾迈斯); JLCPCB Part Class: Extended Part; Datasheet: https://item.szlcsc.com/datasheet/MR30PB-M.G2.Y/55155505.html; Supplier: LCSC
U4 U5 = DRV8317HREER: Drive Type:Three Phase Integrated FETs:Yes Number of Half Bridges:3 Output Current:- Output Current:- Peak Current:5A Voltage - Supply:4.5V~20V Voltage - Supply:4.5V~20V RDS(on):130mΩ Quiescent Current(Iq):3uA Interface:SPI Operating Temperature:-40℃~+125; LCSC Part Name: DRV8317 三相 PWM 电机驱动器; Supplier Part: C6022114; Manufacturer: TI(德州仪器); Supplier Footprint: WQFN-36(4x5); JLCPCB Part Class: Extended Part; Datasheet: https://item.szlcsc.com/datasheet/DRV8317HREER/6960678.html; Supplier: LCSC; Drive Type: Three Phase; Integrated FETs: Yes; Number of Half Bridges: 3; Peak Current: 5A; Voltage - Supply: 4.5V~20V; RDS(on): 130mΩ; Quiescent Current(Iq): 3uA; Interface: SPI; Operating Temperature: -40℃~+125℃; Features: Interleaved conduction protection
J5-J8 J10 = ZX-SH1.0-5PLT: Pins Structure:1x5P Pitch:1mm Mounting Type:Surface Mount,Vertical Reference Series:SH Number of Pins:5P Number of Rows:1 Number of PINs Per Row:5 Row Spacing:- Current Rating:1A Contact Material:Brass Contact Plating:Tin Operating Temperature:-40℃~+85℃ O; LCSC Part Name: 1x5P 间距:1mm 立贴 系列:SH; Supplier Part: C7430454; Manufacturer: Megastar(兆星); Supplier Footprint: SMD,P=1mm; JLCPCB Part Class: Extended Part; Datasheet: https://item.szlcsc.com/datasheet/ZX-SH1.0-5PLT/8430323.html; Supplier: LCSC; Pins Structure: 1x5P; Pitch: 1mm; Mounting Type: Surface Mount,Vertical; Reference Series: SH; Number of Pins: 5P; Number of Rows: 1; Number of PINs Per Row: 5; Current Rating: 1A; Contact Material: Brass; Contact Plating: Tin; Operating Temperature: -40℃~+85℃; Voltage Rating: 50V; Plastic Material: LCP; Supplementary Features: Auxiliary Solder Pin; Color: Beige; Z-Height of the Board: 4.4mm; X-Length of Bottom Edge on Board (Spacing Line): 7.35mm; Y-Width of Bottom Edge on Board: 3.05mm
U6 = ICM-42688-P(TOKMAS): Accelerometer Sensing Axis:X,Y,Z Acceleration Measurement Range (MAX):±16g Acceleration Measurement Range (MAX):±16g Gyroscope Sensing Axis:X,Y,Z Gyroscope Measurement Range (MAX):±2000dps Gyroscope Measurement Range (MAX):±2000dps Sensor Type:IMU (accele; LCSC Part Name: 低功耗高度集成6轴惯性测量单元，集成加速度计和陀螺仪，具有片上运动触发中断和FIFO，可配置辅助数字接口; Supplier Part: C54308212; Manufacturer: Tokmas(托克马斯); Supplier Footprint: LGA-14(2.5x3); JLCPCB Part Class: Extended Part; Datasheet: https://item.szlcsc.com/datasheet/ICM-42688-P(TOKMAS)/57590981.html; Supplier: LCSC; Accelerometer Sensing Axis: X,Y,Z; Acceleration Measurement Range (MAX): ±16g; Gyroscope Sensing Axis: X,Y,Z; Gyroscope Measurement Range (MAX): ±2000dps; Sensor Type: IMU (accelerometer + gyroscope); Output Bits: 16bit; Interface: SPI；I2C; Voltage - Supply: 1.71V~3.6V; Cache Size: 2KB; Standby Current: 12uA; Operating Temperature: -40℃~+85℃

## Nets
+1V1: C12.2 C31.2 C32.2 L2.1 U3.10(DVDD) U3.32(DVDD) U3.51(DVDD) U3.65(VREG_FB)
+3V3: C5.2 C6.2 C29.2 C30.2 C33.2 C34.2 C35.2 C36.2 C37.2 C38.2 C39.2 C40.2 C41.2 C42.2 J5.1 J6.1 J7.1 J8.1 J10.1 L1.2 R1.2 R5.2 R9.2 R13.1 R17.2 R18.2 U3.5(IOVDD) U3.15(IOVDD) U3.24(IOVDD) U3.29(IOVDD) U3.41(IOVDD) U3.50(IOVDD) U3.59(ADC_AVDD) U3.60(IOVDD) U3.64(VREG_VIN) U3.68(USB_OTP_VDD) U3.69(QSPI_IOVDD) U3.76(IOVDD) U6.5(VDDIO) U6.8(VDD) U7.8(VCC)
GND: C1.2 C2.1 C3.1 C4.1 C5.1 C6.1 C8.1 C9.1 C10.1 C11.1 C12.1 C15.1 C16.1 C17.1 C18.2 C19.2 C24.2 C25.2 C26.1 C27.1 C28.1 C29.1 C30.1 C31.1 C32.1 C33.1 C34.1 C35.1 C36.1 C37.1 C38.1 C39.1 C40.1 C41.1 C42.1 C43.2 C44.2 D4.2(K) J1.1(-) J2.1(EH) J2.2(EH) J2.3(EH) J2.4(EH) J2.A1B12(GND) J2.B1A12(GND) J5.2 J6.2 J7.2 J8.2 J10.2 R2.1 R4.1 R6.1 R7.1 R19.1 R20.2 SW1.1 SW2.4 SW3.1 U1.1(GND) U3.62(VREG_PGND) U3.81(GND) U4.10(PGND) U4.13(PGND) U4.16(PGND) U4.19(PGND) U4.21(AGND) U4.29(GAIN) U4.37(PAD) U5.10(PGND) U5.13(PGND) U5.16(PGND) U5.19(PGND) U5.21(AGND) U5.29(GAIN) U5.37(PAD) U6.6(GND) U6.7(RESV) U7.4(GND) Y1.2(GND) Y1.4(GND)
VBAT: C1.1 C2.2 C14.2 C15.2 C16.2 C17.2 C22.2 C26.2 C27.2 C28.2 D2.2(+) J1.2(+) R3.2 U4.7(VIN_AVDD) U4.8(VM) U4.9(VM) U4.20(VM) U5.7(VIN_AVDD) U5.8(VM) U5.9(VM) U5.20(VM)
VBAT_SENSE: C8.2 R3.1 R4.2 U3.54(GPIO43_ADC3)
VBUS: D3.2(+) J2.A4B9(VBUS) J2.B4A9(VBUS)
BUCK_SW: C7.2 L1.1 U1.2(SW)
DRV1_AVDD: C18.1 C19.1 C43.1 U4.22(AVDD) U4.24(INLA) U4.26(INLB) U4.28(INLC) U4.31(MODE) U4.33(CSAREF)
DRV1_CP: C14.1 U4.6(CP)
DRV1_CPH: C13.2 U4.5(CPH)
DRV1_CPL: C13.1 U4.4(CPL)
DRV2_AVDD: C24.1 C25.1 C44.1 U5.22(AVDD) U5.24(INLA) U5.26(INLB) U5.28(INLC) U5.31(MODE) U5.33(CSAREF)
DRV2_CP: C22.1 U5.6(CP)
DRV2_CPH: C21.2 U5.5(CPH)
DRV2_CPL: C21.1 U5.4(CPL)
DRV_NFAULT: R13.2 U3.40(GPIO32) U4.2(nFAULT) U5.2(nFAULT)
DRV_NSLEEP: R20.1 U3.39(GPIO31) U4.1(nSLEEP) U5.1(nSLEEP)
EXP_IO: J10.3 U3.3(GPIO6)
EXP_RX: J10.4 U3.2(GPIO5)
EXP_TX: J10.5 U3.1(GPIO4)
IMU_CS: U3.20(GPIO20) U6.12(SENB)
IMU_INT1: U3.12(GPIO13) U6.4(INT1)
M1_A: J3.1 U4.11(OUTA) U4.12(OUTA)
M1_B: J3.2 U4.14(OUTB) U4.15(OUTB)
M1_C: J3.3 U4.17(OUTC) U4.18(OUTC)
M1_ENC_A: J5.3 U3.9(GPIO11)
M1_ENC_B: J5.4 U3.8(GPIO10)
M1_ENC_Z: J5.5 U3.7(GPIO9)
M1_INA: U3.45(GPIO36) U4.23(INHA)
M1_INB: U3.44(GPIO35) U4.25(INHB)
M1_INC: U3.43(GPIO34) U4.27(INHC)
M1_SOA: U3.49(GPIO40_ADC0) U4.36(SOA)
M1_SOB: U3.52(GPIO41_ADC1) U4.35(SOB)
M1_SOC: U3.53(GPIO42_ADC2) U4.34(SOC)
M2_A: J4.1 U5.11(OUTA) U5.12(OUTA)
M2_B: J4.2 U5.14(OUTB) U5.15(OUTB)
M2_C: J4.3 U5.17(OUTC) U5.18(OUTC)
M2_ENC_A: J6.3 U3.28(GPIO27)
M2_ENC_B: J6.4 U3.27(GPIO26)
M2_ENC_Z: J6.5 U3.26(GPIO25)
M2_INA: U3.48(GPIO39) U5.23(INHA)
M2_INB: U3.47(GPIO38) U5.25(INHB)
M2_INC: U3.46(GPIO37) U5.27(INHC)
M2_SOA: U3.55(GPIO44_ADC4) U5.36(SOA)
M2_SOB: U3.56(GPIO45_ADC5) U5.35(SOB)
M2_SOC: U3.57(GPIO46_ADC6) U5.34(SOC)
ODO1_A: J7.3 U3.23(GPIO23)
ODO1_B: J7.4 U3.22(GPIO22)
ODO1_Z: J7.5 U3.21(GPIO21)
ODO2_A: J8.3 U3.38(GPIO30)
ODO2_B: J8.4 U3.37(GPIO29)
ODO2_Z: J8.5 U3.36(GPIO28)
QSPI_SCLK: U3.71(QSPI_SCLK) U7.6(CLK)
QSPI_SD0: U3.72(QSPI_SD0) U7.5(DI)
QSPI_SD1: U3.74(QSPI_SD1) U7.2(DO)
QSPI_SD2: U3.73(QSPI_SD2) U7.3(IO2)
QSPI_SD3: U3.70(QSPI_SD3) U7.7(IO3)
QSPI_SS: R10.2 U3.75(QSPI_SS) U7.1(CS#)
SPI_MISO: U3.16(GPIO16) U6.1(SDO)
SPI_MOSI: U3.19(GPIO19) U6.14(SDA)
SPI_SCK: U3.18(GPIO18) U6.13(SCK)
START_BTN: R18.1 SW2.1 U3.25(GPIO24)
STATUS_LED: LED1.1(A) U3.4(GPIO7)
USB_DN: J2.A7(DN1) J2.B7(DN2) R11.1
USB_DP: J2.A6(DP1) J2.B6(DP2) R16.1
VSYS: C3.2 C4.2 D2.1(-) D3.1(-) U1.3(VIN)
XIN: C10.2 U3.30(XIN) Y1.3
XOUT: R8.1 U3.31(XOUT)
$1N59: C7.1 U1.6(BOOT)
$1N62: R1.1 R2.2 U1.4(FB)
$1N64: J2.A5(CC1) R6.2
$1N65: J2.B5(CC2) R7.2
$1N120: D4.1(A) R5.1
$2N150: R17.1 SW1.2 U3.35(RUN)
$2N151: R10.1 SW3.2
$2N168: C11.2 R9.1 U3.61(VREG_AVDD)
$2N201: LED1.2(K) R19.2
$2N244: R11.2 U3.66(USB_DM)
$2N245: R16.2 U3.67(USB_DP)
$2N246: C9.2 R8.2 Y1.1
$2N253: L2.2 U3.63(VREG_LX)

Not connected (* = marked no-connect by the designer): J2 A8(SBU1) B8(SBU2); J5 6 7; J6 6 7; J7 6 7; J8 6 7; J10 6 7; SW2 2 3; U1 5(EN); U3 6(GPIO8) 11(GPIO12) 13(GPIO14) 14(GPIO15) 17(GPIO17) 33(SWCLK) 34(SWDIO) 42(GPIO33) 58(GPIO47_ADC7) 77(GPIO0) 78(GPIO1) 79(GPIO2) 80(GPIO3); U4 3(NC) 30(SLEW) 32(NC); U5 3(NC) 30(SLEW) 32(NC); U6 2(MSDA) 3(MCLK) 9(INT2) 10(CSB2) 11(RESV)

## Notes on the sheets
sheet 1
- 3V3 BUCK  (VBAT / VBUS OR-ing)
- 3V3 BUCK  (VBAT / VBUS OR-ing)
- BATTERY INPUT  (8x AA NiMH pack, XT30)
- BATTERY INPUT  (8x AA NiMH pack, XT30)
- BATTERY INPUT  (8x AA NiMH pack, XT30)
- 3V3 LED
- USB-C  (programming / debug)
sheet 2
- CORE AND I/O DECOUPLING
- DECOUPLING  (+1V1 core, +3V3 IO / ADC / USB / QSPI)
- DECOUPLING  (+1V1 core, +3V3 IO / ADC / USB / QSPI)
- DECOUPLING  (+1V1 core, +3V3 IO/ADC/USB/QSPI)
- RP2350B MCU  (dual M33, 8x ADC for 6 phase currents + VBAT, PIO encoders)
- RP2350B MCU  (8x ADC: 6 phase currents + VBAT, PIO quadrature for 4 encoders)
- RP2350B MICROCONTROLLER
- RP2350B MCU  (8x ADC: 6 phase currents + VBAT, PIO quadrature for 4 encoders)
- RP2350B MCU  (8x ADC: 6 phase currents + VBAT, PIO quadrature for 4 encoders)
- 12 MHz CRYSTAL
- 12 MHz CRYSTAL
- 12 MHz CRYSTAL
- RESET
- RESET
- 12 MHz CRYSTAL
- START BUTTON
- START BUTTON  12x12 mm (pencil)
- START BUTTON  12x12 mm (pencil)
- STATUS RGB LED
- RESET
- RESET
- RESET
- RESET
- RESET
- ESP32-S3 (WiFi/BLE + native USB)
- STATUS LED
- STATUS LED
- STATUS LED
- CORE REGULATOR / USB
- CORE VREG + USB
- BOOT / START (pencil) BUTTON
- BOOT / START (pencil) BUTTON
- CORE VREG + USB
- IO45 STRAP (keeps drivers off at boot)
- 16 MB QSPI FLASH / BOOT
- QSPI FLASH 16 MB + BOOT
- QSPI FLASH 16 MB + BOOT BUTTON
- 3V3 DECOUPLING
sheet 3
- DRV1 SUPPORT
- DRV1 support (charge pump, unused buck, AVDD/VREF, nFAULT pull-up)
- FOC DRIVER 1  (LEFT wheel)  DRV8316R
- FOC DRIVER 1 - LEFT WHEEL (DRV8316R)
- LEFT MOTOR DRIVER / DRV8317H
- MOTOR 1
- VM BYPASS 1
- VM BYPASS 1
- SDO PULL-UP
- DRV2 SUPPORT
- FOC DRIVER 2 - RIGHT WHEEL (DRV8316R)
- RIGHT MOTOR DRIVER / DRV8317H
- MOTOR 2
- VM BYPASS 2
- VM BYPASS 2
sheet 4
- ICM-42688-P IMU / SPI
- IMU - LSM6DSV16X (SPI, heading hold)
- MOTOR ENCODERS / ABZ
- MOTOR ENCODER PORTS (SPI / ABZ / I2C)
- ODOMETRY WHEEL PORTS (quadrature)
- START TRIGGER
- EXPANSION (UART)
